# Altium schematic sheet Detektor_otwarcia.SchDoc
size A3
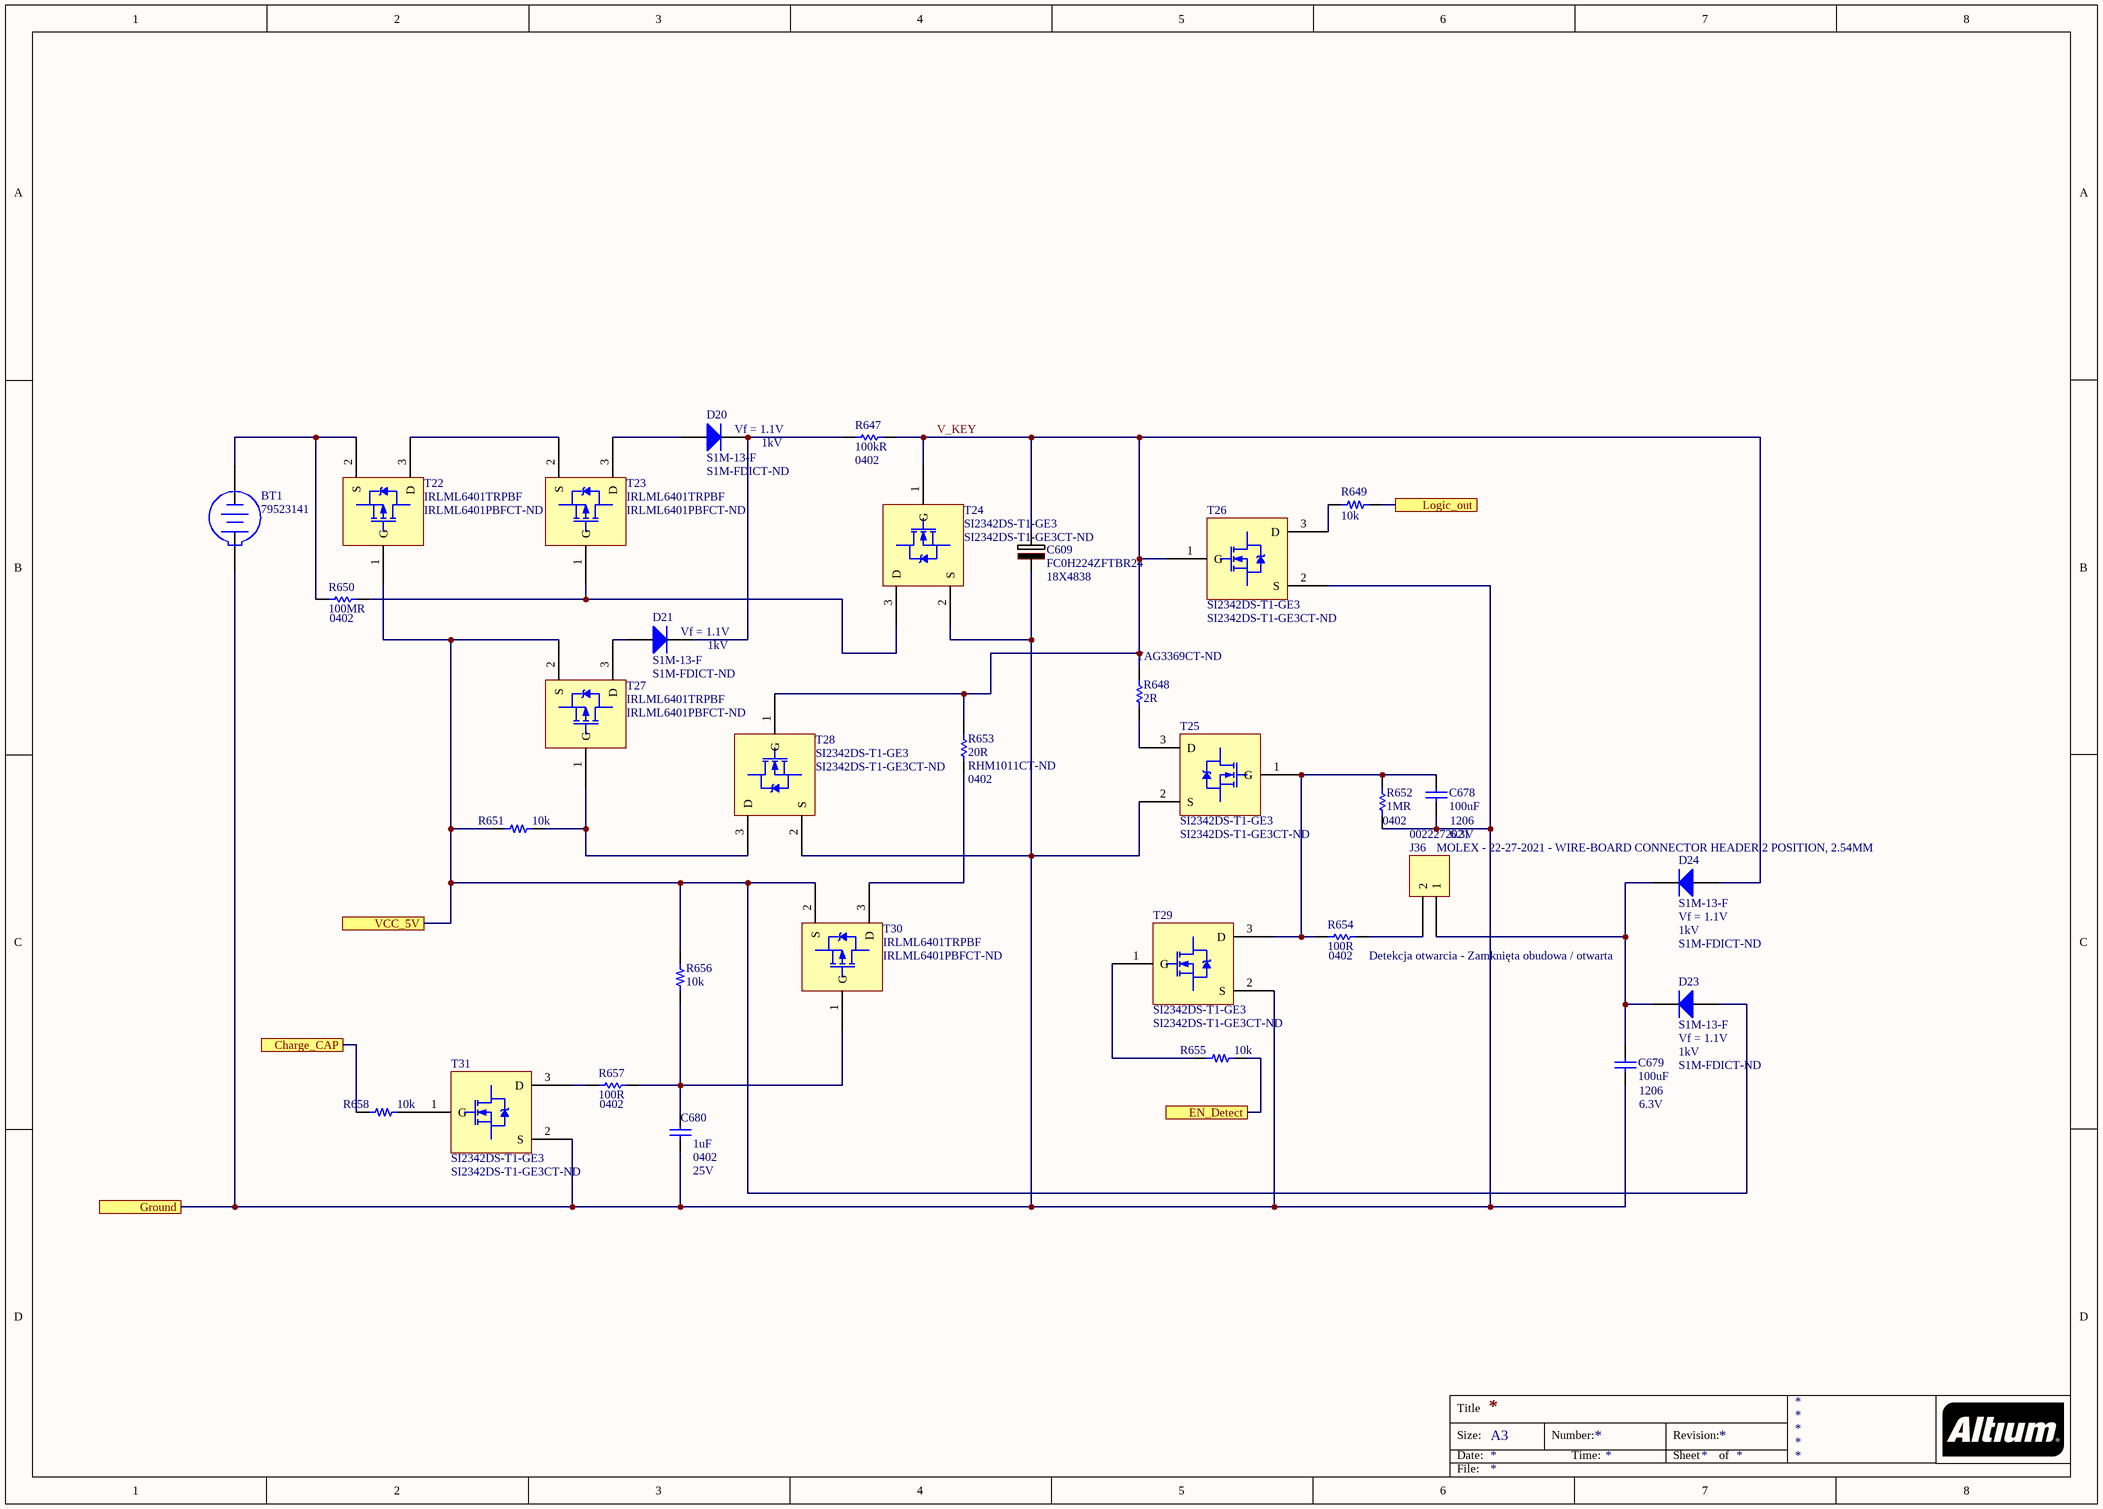
[diagram p0: Detektor_otwarcia.SchDoc]

## Parts
BT1  79523141  [79523141]
C609  FC0H224ZFTBR24  Supplier Part Number 1: 18X4838  [FC0H224ZFTBR24]
C678  100uF  Case/Package: 1206  Voltage Rating: 6.3V  [CAP 1206/3216]
C679  100uF  Case/Package: 1206  Voltage Rating: 6.3V  [CAP 1206/3216]
C680  1uF  Case/Package: 0402  Voltage Rating: 25V  [CAP 0402/1005 KK]
D20  S1M-13-F  Forward Voltage: Vf = 1.1V  Reverse Voltage (DC): 1kV  Supplier Part Number 1: S1M-FDICT-ND  [S1M-13-F]
D21  S1M-13-F  Forward Voltage: Vf = 1.1V  Reverse Voltage (DC): 1kV  Supplier Part Number 1: S1M-FDICT-ND  [S1M-13-F]
D23  S1M-13-F  Forward Voltage: Vf = 1.1V  Reverse Voltage (DC): 1kV  Supplier Part Number 1: S1M-FDICT-ND  [S1M-13-F]
D24  S1M-13-F  Forward Voltage: Vf = 1.1V  Reverse Voltage (DC): 1kV  Supplier Part Number 1: S1M-FDICT-ND  [S1M-13-F]
J36  MOLEX - 22-27-2021 - WIRE-BOARD CONNECTOR HEADER 2 POSITION, 2.54MM  Supplier Part Number 1: 0022272021  [MOLEX KK 0022272021]
R647  100kR  Case/Package: 0402  [RES 0402/1005 RF KK]
R648  2R  Supplier Part Number 1: YAG3369CT-ND  [RES 0402/1005 RF KK]
R649  10k  [RES 0402/1005 RF KK]
R650  100MR  Case/Package: 0402  [RES 0402/1005 RF KK]
R651  10k  [RES 0402/1005 RF KK]
R652  1MR  Case/Package: 0402  [RES 0402/1005 RF KK]
R653  20R  Supplier Part Number 1: RHM1011CT-ND  Case/Package: 0402  [RES 0402/1005 RF KK]
R654  100R  Case/Package: 0402  [RES 0402/1005 RF KK]
R655  10k  [RES 0402/1005 RF KK]
R656  10k  [RES 0402/1005 RF KK]
R657  100R  Case/Package: 0402  [RES 0402/1005 RF KK]
R658  10k  [RES 0402/1005 RF KK]
T22  IRLML6401TRPBF  Supplier Part Number 1: IRLML6401PBFCT-ND  [IRLML6401PbF]
T23  IRLML6401TRPBF  Supplier Part Number 1: IRLML6401PBFCT-ND  [IRLML6401PbF]
T24  SI2342DS-T1-GE3  Supplier Part Number 1: SI2342DS-T1-GE3CT-ND  [SI2342DS-T1-GE3]
T25  SI2342DS-T1-GE3  Supplier Part Number 1: SI2342DS-T1-GE3CT-ND  [SI2342DS-T1-GE3]
T26  SI2342DS-T1-GE3  Supplier Part Number 1: SI2342DS-T1-GE3CT-ND  [SI2342DS-T1-GE3]
T27  IRLML6401TRPBF  Supplier Part Number 1: IRLML6401PBFCT-ND  [IRLML6401PbF]
T28  SI2342DS-T1-GE3  Supplier Part Number 1: SI2342DS-T1-GE3CT-ND  [SI2342DS-T1-GE3]
T29  SI2342DS-T1-GE3  Supplier Part Number 1: SI2342DS-T1-GE3CT-ND  [SI2342DS-T1-GE3]
T30  IRLML6401TRPBF  Supplier Part Number 1: IRLML6401PBFCT-ND  [IRLML6401PbF]
T31  SI2342DS-T1-GE3  Supplier Part Number 1: SI2342DS-T1-GE3CT-ND  [SI2342DS-T1-GE3]

## Ports
Charge_CAP, EN_Detect, Ground, Logic_out, VCC_5V

## Nets
Charge_CAP: R658.2 ; port Charge_CAP
EN_Detect: R655.1 ; port EN_Detect
Ground: BT1.1(+) C609.1(-) C678.1 C679.1 C680.2 R652.1 T24.2(S) T25.2(S) T26.2(S) T28.2(S) T29.2(S) T31.2(S) ; port Ground
Logic_out: R649.1 ; port Logic_out
V_KEY: C609.2(+) D24.2(A) R647.1 R648.1 R653.1 T24.1(G) T26.1(G) T28.1(G)
VCC_5V: D23.2(A) R651.2 R656.1 T22.1(G) T27.2(S) T30.2(S) ; port VCC_5V
NetBT1_2: BT1.2(-) R650.1 T22.2(S)
NetC678_2: C678.2 R652.2 R654.1 T25.1(G) T29.3(D)
NetC679_2: C679.2 D23.1(K) D24.1(K) J36.1
NetC680_1: C680.1 R656.2 R657.2 T30.1(G)
NetD20_1: D20.1(K) D21.1(K) R647.2
NetD20_2: D20.2(A) T23.3(D)
NetD21_2: D21.2(A) T27.3(D)
NetJ36_2: J36.2 R654.2
NetR648_2: R648.2 T25.3(D)
NetR649_2: R649.2 T26.3(D)
NetR650_2: R650.2 T23.1(G) T24.3(D)
NetR651_1: R651.1 T27.1(G) T28.3(D)
NetR653_2: R653.2 T30.3(D)
NetR655_2: R655.2 T29.1(G)
NetR657_1: R657.1 T31.3(D)
NetR658_1: R658.1 T31.1(G)
NetT22_3: T22.3(D) T23.2(S)

## Notes on the sheet
- (near R654) Detekcja otwarcia - Zamknięta obudowa / otwarta
- Title
- Size:
- Date:
- A3
- Number:
- Time:
- Revision:
- Sheet
- of
- File:

## Library data of the parts
BT1 = 79523141: WA-BCMC Battery Holder, SMT, Battery Type 2016/2020/2025/2032; ComponentLink1Description: Manufacturer; ComponentLink1URL: http://www.we-online.de; ComponentLink2Description: Datasheet; ComponentLink2URL: https://katalog.we-online.com/em/datasheet/79523141.pdf; Published Date: September 2019; Mounting Technology: SMT; Packaging: Tape and Reel; Battery Type: 2016/2020/2025/2032; Publisher: Wurth Elektronik; Part Number: 79523141
C609 = FC0H224ZFTBR24: Supercapacitors / Ultracapacitors 0.22F 5.5volts SMD Super Capacitor; Manufacturer: KEMET; Capacitance: 220mF; Tolerance: 80%; Voltage Rating: 5.5V; ESR (Equivalent Series Resistance): 25R; Leakage Current: 330uA; Supplier 1: Newark; Manufacturer Part Number: FC0H224ZFTBR24; RoHS: Yes; Category: Capacitors; Mount: Surface Mount; Case/Package: Radial; Min Operating Temperature: -25°C; Max Operating Temperature: 70°C; Package Quantity: 500; Packaging: Tape and Reel; Voltage Rating (DC): 5.5V; Termination: SMD/SMT; Voltage: 5.5V; Diameter: 10.5mm; Length: 10.8mm; Height: 8.5mm; Width: 10.8mm; Height - Seated (Max): 0.335inch; Lead Pitch: 5mm; Depth: 8.5mm; Radiation Hardening: No; REACH SVHC: No SVHC; ComponentLink1URL: https://datasheet.ciiva.com/29533/docfinderpartnumber-fc0h224zftbr24-29533957.pdf?src-supplier=Digi-Key; ComponentLink1Description: https://datasheet.ciiva.com/29533/docfinderpartnumber-fc0h224zftbr24-29533957.pdf?src-supplier=Digi-Key; ComponentLink2URL: https://datasheet.ciiva.com/46644/70368307-46644566.pdf?src-supplier=Allied+Electronics; ComponentLink2Description: https://datasheet.ciiva.com/46644/70368307-46644566.pdf?src-supplier=Allied+Electronics; ComponentLink3URL: https://datasheet.ciiva.com/28448/1754672-28448906.pdf?src-supplier=Element14; ComponentLink3Description: https://datasheet.ciiva.com/28448/1754672-28448906.pdf?src-supplier=Element14; ComponentLink4URL: https://datasheet.ciiva.com/29984/kem-s6011-fc-29984986.pdf?src-supplier=Avnet; ComponentLink4Description: https://datasheet.ciiva.com/29984/kem-s6011-fc-29984986.pdf?src-supplier=Avnet
C678 C679 = Capacitor: Cap Ceramic 100uF 6.3V X6T 20% Pad SMD 1206 105C T/R; Manufacturer: Murata; Manufacturer Part Number: GRM31CD80J107ME39L; Dissipation Factor: 0.1%; Supplier 1: Digi-Key; Supplier Part Number 1: 490-10525-1-ND; RoHS: Yes; Category: Ceramic Capacitors; Stock 1: 262558; Pricing 1: 1=0,76000, 10=0,56100, 100=0,38470, 500=0,30454, 1000=0,25645 (USD); Mount: Surface Mount; Weight: 0.001411oz; Case Code (Metric): 3216; Case Code (Imperial): 1206; Material: Ceramic; Dielectric Material: Ceramic; Min Operating Temperature: -55°C; Max Operating Temperature: 105°C; Capacitance: 100uF; Tolerance: 20%; Dielectric: X6T; Packaging: Tape and Reel; Voltage: 6.3V; Termination: SMD/SMT; Voltage Rating (DC): 6.3V; Package Quantity: 2000; Length: 3.2mm; Height: 1.6mm; Width: 1.6mm; Thickness: 0.071inch; Depth: 1.6mm; Radiation Hardening: No; REACH SVHC: No SVHC; Lead Free: Lead Free; ComponentLink1URL: https://datasheet.ciiva.com/7719/608985-7719130.pdf?src-supplier=Element14; ComponentLink1Description: https://datasheet.ciiva.com/7719/608985-7719130.pdf?src-supplier=Element14
C680 = Capacitor: MURATA - GRT155R61E105KE01D - SMD Multilayer Ceramic Capacitor, 1 µF, 25 V, 0402 [1005 Metric], ± 10%, X5R, GRT Series - SMD Multilayer Ceramic Capacitor, 1 µF, 25 V, 0402 [1005 Metric], ± 10%, X5R, GRT Series; Supplier 1: Digi-Key; Supplier Part Number 1: 490-12263-1-ND; Manufacturer: Murata; Manufacturer Part Number: GRT155R61E105KE01D; RoHS: Yes; Category: Ceramic Capacitors; Stock 1: 341453; Pricing 1: 1=0,18000, 10=0,12300, 100=0,06210, 500=0,04248, 1000=0,03758, 2500=0,03594, 5000=0,03268 (USD); Mount: Surface Mount; Case Code (Metric): 1005; Case Code (Imperial): 0402; Min Operating Temperature: -55°C; Max Operating Temperature: 85°C; Packaging: Tape and Reel; Capacitance: 1uF; Tolerance: 10%; Dielectric: X5R; Voltage Rating (DC): 25V; Length: 0.039inch; Width: 0.02inch; Thickness: 0.022inch; Ratings: AEC-Q200; ComponentLink1URL: http://www.farnell.com/datasheets/2165918.pdf?src-supplier=Farnell; ComponentLink1Description: http://www.farnell.com/datasheets/2165918.pdf?src-supplier=Farnell; ComponentLink2URL: http://search.murata.co.jp/Ceramy/image/img/A01X/G101/ENG/GRT155R61E105KE01-01.pdf?src-supplier=Digi-Key; ComponentLink2Description: http://search.murata.co.jp/Ceramy/image/img/A01X/G101/ENG/GRT155R61E105KE01-01.pdf?src-supplier=Digi-Key; ComponentLink3URL: http://www.farnell.com/datasheets/2165918.pdf?src-supplier=Element14; ComponentLink3Description: http://www.farnell.com/datasheets/2165918.pdf?src-supplier=Element14
D20 D21 D23 D24 = S1M-13-F: DIODE GEN PURP 1KV 1A SMA; Manufacturer: Diodes; Recovery Time: 1.8us; Peak Reverse Current: 5uA; Reverse Recovery Time: 3us; Peak Non-Repetitive Surge Current: 30A; Polarity: Standard; Capacitance: 10pF; Supplier 1: Digi-Key; Manufacturer Part Number: S1M-13-F; RoHS: Yes; Category: Rectifier Diodes; Stock 1: 1021310; Pricing 1: 1=0,25000, 10=0,20100, 25=0,16840, 100=0,08240, 250=0,08104, 500=0,06870, 1000=0,04774, 2500=0,04437 (USD); Case/Package: SMA; Number of Pins: 2; Weight: 0.002258oz; Min Operating Temperature: -65°C; Max Operating Temperature: 150°C; Package Quantity: 5000; Forward Current: 1A; Packaging: Tape and Reel; Average Rectified Current: 1A; Max Repetitive Reverse Voltage (Vrrm): 1kV; Max Forward Surge Current (Ifsm): 30A; Voltage Rating (DC): 1kV; Current Rating: 1A; Output Current: 1A; Max Reverse Voltage (DC): 1kV; Termination: SMD/SMT; Length: 4.6mm; Height: 2.1mm; Width: 2.92mm; Radiation Hardening: No; REACH SVHC: No SVHC; Lead Free: Lead Free; ComponentLink1URL: https://datasheet.ciiva.com/34302/1541642-34302418.pdf?src-supplier=Jameco; ComponentLink1Description: https://datasheet.ciiva.com/34302/1541642-34302418.pdf?src-supplier=Jameco; ComponentLink2URL: https://datasheet.ciiva.com/22695/1911706-22695834.pdf?src-supplier=Element14; ComponentLink2Description: https://datasheet.ciiva.com/22695/1911706-22695834.pdf?src-supplier=Element14
J36 = 2 Pin: Number of Contacts: 2; Gender: Male; Contact Resistance: 20mR; Current Rating: 4A; Voltage Rating (DC): 250V; Insulation Resistance: 50GR; Approvals: UL,CSA; Supplier 1: Avnet; Manufacturer: Molex; Manufacturer Part Number: 22-27-2021; RoHS: Yes; Category: Headers and Wire Housings; Stock 1: 3474; Pricing 1: 1=0,12370, 10=0,11289, 30=0,10755, 50=0,10087, 100=0,09486 (USD); Mount: Through Hole; Contact Plating: Tin,Copper; Contact Material: Brass,Tin; Housing Color: Natural; Color: White; Housing Material: Nylon; Material: Nylon; Min Operating Temperature: 0°C; Max Operating Temperature: 75°C; Termination: Solder; Number of Rows: 1; Orientation: Straight; Number of Positions: 2; Packaging: Bulk; Package Quantity: 24000; Contact Gender: Male; Number of Circuits: 2; Working Voltage: 250V; Voltage Rating (AC): 250V; Voltage Rating: 250V; Max Current Rating: 4A; Length: 10.16mm; Height: 11.7mm; Pitch: 2.54mm; Depth: 5.8mm; Lead Pitch: 2.54mm; Radiation Hardening: No; Lead Free: Lead Free; Flammability Rating: UL94 V-0; REACH SVHC: Unknown; ComponentLink1URL: https://datasheet.ciiva.com/9468/0022272021-pcb-headers-9468403.pdf?src-supplier=Avnet; ComponentLink1Description: https://datasheet.ciiva.com/9468/0022272021-pcb-headers-9468403.pdf?src-supplier=Avnet; ComponentLink2URL: https://datasheet.ciiva.com/30177/113940022272021-pcb-headers-30177601.pdf?src-supplier=Onlinecomponents.com; ComponentLink2Description: https://datasheet.ciiva.com/30177/113940022272021-pcb-headers-30177601.pdf?src-supplier=Onlinecomponents.com; ComponentLink3URL: https://datasheet.ciiva.com/15217/getdatasheetpartid-163454-15217683.pdf?src-supplier=Verical; ComponentLink3Description: https://datasheet.ciiva.com/15217/getdatasheetpartid-163454-15217683.pdf?src-supplier=Verical; ComponentLink4URL: https://datasheet.ciiva.com/5154/0022272021-pcb-headers-227458-5154933.pdf?src-supplier=Mouser; ComponentLink4Description: https://datasheet.ciiva.com/5154/0022272021-pcb-headers-227458-5154933.pdf?src-supplier=Mouser; ComponentLink5URL: https://datasheet.ciiva.com/11746/0900766b804624e4-11746551.pdf?src-supplier=RSComponents; ComponentLink5Description: https://datasheet.ciiva.com/11746/0900766b804624e4-11746551.pdf?src-supplier=RSComponents; ComponentLink6URL: https://datasheet.ciiva.com/19462/879254-19462349.pdf?src-supplier=Jameco; ComponentLink6Description: https://datasheet.ciiva.com/19462/879254-19462349.pdf?src-supplier=Jameco; ComponentLink7URL: https://datasheet.ciiva.com/25908/0022272021-pcb-headers-25908245.pdf?src-supplier=Avnet+Europe; ComponentLink7Description: https://datasheet.ciiva.com/25908/0022272021-pcb-headers-25908245.pdf?src-supplier=Avnet+Europe; ComponentLink8URL: https://datasheet.ciiva.com/20207/22-0838e-20207111.pdf?src-supplier=Rapid+Electronics; ComponentLink8Description: https://datasheet.ciiva.com/20207/22-0838e-20207111.pdf?src-supplier=Rapid+Electronics
R647 = Resistor: Manufacturer 1: Panasonic; Manufacturer Part Number 1: ERA-2AED104X; Tolerance: 0.5%; Power Rating: 63mW; Voltage Rating: 25V; Temperature Coefficient: 25ppm/°C; Supplier 1: Digi-Key; Supplier Part Number 1: P100KDECT-ND; Stock 1: 54338; Pricing 1: 1=0.22000, 10=0.18800, 100=0.07350, 1000=0.03077, 2500=0.02820, 5000=0.02564 (USD); RoHS: Yes; Mount: Surface Mount; Case Code (Imperial): 0402; Case Code (Metric): 1005; Contact Plating: Tin; Min Operating Temperature: -55°C; Max Operating Temperature: 155°C; Resistance: 100kR; Packaging: Tape and Reel; Package Quantity: 10000; Composition: Metal Film,Thin Film; Number of Terminations: 2; Military Standard: Not; Termination: SMD/SMT; Max Power Dissipation: 63mW; Voltage Rating (DC): 25V; Length: 1mm; Height: 0.016inch; Width: 0.5mm; Depth: 0.5mm; Radiation Hardening: No; REACH SVHC: No SVHC; Lead Free: Lead Free; ComponentLink1URL: https://datasheet.ciiva.com/24028/aoa0000ce26-197354-24028150.pdf?src-supplier=Mouser; ComponentLink1Description: https://datasheet.ciiva.com/24028/aoa0000ce26-197354-24028150.pdf?src-supplier=Mouser; ComponentLink2URL: https://datasheet.ciiva.com/43470/1776116-43470438.pdf?src-supplier=Farnell; ComponentLink2Description: https://datasheet.ciiva.com/43470/1776116-43470438.pdf?src-supplier=Farnell; ComponentLink3URL: https://datasheet.ciiva.com/7830/1776116-7830920.pdf?src-supplier=Element14; ComponentLink3Description: https://datasheet.ciiva.com/7830/1776116-7830920.pdf?src-supplier=Element14; ComponentLink4URL: https://datasheet.ciiva.com/46378/1776116-46378234.pdf?src-supplier=Element14; ComponentLink4Description: https://datasheet.ciiva.com/46378/1776116-46378234.pdf?src-supplier=Element14; ComponentLink5URL: https://datasheet.ciiva.com/16780/70068849-16780139.pdf?src-supplier=Allied+Electronics; ComponentLink5Description: https://datasheet.ciiva.com/16780/70068849-16780139.pdf?src-supplier=Allied+Electronics; ComponentLink6URL: https://datasheet.ciiva.com/9117/aoa0000ce26-9117229.pdf?src-supplier=Avnet; ComponentLink6Description: https://datasheet.ciiva.com/9117/aoa0000ce26-9117229.pdf?src-supplier=Avnet; ComponentLink7URL: https://datasheet.ciiva.com/16511/aoa0000ce26-16511566.pdf?src-supplier=Avnet+Asia; ComponentLink7Description: https://datasheet.ciiva.com/16511/aoa0000ce26-16511566.pdf?src-supplier=Avnet+Asia; ComponentLink8URL: https://datasheet.ciiva.com/30225/54aoa0000ce26-30225311.pdf?src-supplier=Onlinecomponents.com; ComponentLink8Description: https://datasheet.ciiva.com/30225/54aoa0000ce26-30225311.pdf?src-supplier=Onlinecomponents.com
R648 = Resistor: Manufacturer 1: Yageo; Manufacturer Part Number 1: RC0402FR-072RL; Power Rating: 63mW; Tolerance: 1%; Voltage Rating: 50V; Temperature Coefficient: 200ppm/°C; Supplier 1: Digi-Key; Stock 1: 417064; Pricing 1: 1=0,10000, 10=0,02400, 100=0,00970, 1000=0,00435, 2500=0,00377, 5000=0,00312 (USD); RoHS: Yes; Case/Package: 0402; Case Code (Imperial): 0402; Case Code (Metric): 1005; Contact Plating: Tin,Matte; Min Operating Temperature: -55°C; Max Operating Temperature: 155°C; Resistance: 2R; Packaging: Tape and Reel; Composition: Thick Film; Termination: SMD/SMT; Number of Terminations: 2; Military Standard: Not; Max Power Dissipation: 63mW; Voltage Rating (DC): 50V; Features: Moisture Resistant; Length: 1mm; Height: 0.016inch; Width: 0.02inch; Depth: 0.5mm; REACH SVHC: Unknown; Lead Free: Lead Free; ComponentLink1URL: https://datasheet.ciiva.com/11808/0900766b80c66297-11808785.pdf?src-supplier=RSComponents; ComponentLink1Description: https://datasheet.ciiva.com/11808/0900766b80c66297-11808785.pdf?src-supplier=RSComponents; ComponentLink2URL: https://datasheet.ciiva.com/16868/pyu-rc0402-51-rohs-l-6-16868438.pdf?src-supplier=Avnet+Europe; ComponentLink2Description: https://datasheet.ciiva.com/16868/pyu-rc0402-51-rohs-l-6-16868438.pdf?src-supplier=Avnet+Europe; ComponentLink3URL: https://datasheet.ciiva.com/5596/pyu-rc0402-51-rohs-l-6-r-5596055.pdf?src-supplier=Mouser; ComponentLink3Description: https://datasheet.ciiva.com/5596/pyu-rc0402-51-rohs-l-6-r-5596055.pdf?src-supplier=Mouser; ComponentLink4URL: https://datasheet.ciiva.com/28415/pyu-rc0402-51-rohs-l-6-28415608.pdf?src-supplier=Avnet+Europe; ComponentLink4Description: https://datasheet.ciiva.com/28415/pyu-rc0402-51-rohs-l-6-28415608.pdf?src-supplier=Avnet+Europe; ComponentLink5URL: https://datasheet.ciiva.com/8894/pyu-rc0402-51-rohs-l-6-8894730.pdf?src-supplier=Avnet; ComponentLink5Description: https://datasheet.ciiva.com/8894/pyu-rc0402-51-rohs-l-6-8894730.pdf?src-supplier=Avnet; ComponentLink6URL: https://datasheet.ciiva.com/7849/1018594-7849950.pdf?src-supplier=Element14; ComponentLink6Description: https://datasheet.ciiva.com/7849/1018594-7849950.pdf?src-supplier=Element14; ComponentLink7URL: https://datasheet.ciiva.com/7849/1018594-7849951.pdf?src-supplier=Element14; ComponentLink7Description: https://datasheet.ciiva.com/7849/1018594-7849951.pdf?src-supplier=Element14
R649 R651 R655 R656 R658 = Resistor: SMT Resistor; Value: 10k; Part Number: *; Supplier 1: Digi-Key; Supplier Part Number 1: RR05P10.0KDCT-ND
R650 = Resistor: RES SMD 100M OHM 5% 1/16W 0402; Manufacturer: Stackpole Electronics; Manufacturer Part Number: HMC0402JT100M; Max Power Dissipation: 63mW; Temperature Coefficient: 400ppm/°C; Supplier 1: Digi-Key; Supplier Part Number 1: HMC0402JT100MCT-ND; RoHS: Yes; Category: Chip SMD Resistors; Stock 1: 245588; Pricing 1: 1=0,38000, 10=0,31800, 100=0,12420, 1000=0,05198, 2500=0,04764, 5000=0,04331 (USD); Mount: Surface Mount; Case Code (Metric): 1005; Case Code (Imperial): 0402; Min Operating Temperature: -55°C; Max Operating Temperature: 125°C; Resistance: 100MR; Tolerance: 5%; Packaging: Tape and Reel; Composition: Thick Film; Number of Terminations: 2; Military Standard: Not; Length: 0.039inch; Height: 0.016inch; Width: 0.02inch; Depth: 0.5mm; Lead Free: Lead Free; ComponentLink1URL: http://components.arrow.com/part/dataview/58476149S797766N1174?src-supplier=Arrow; ComponentLink1Description: http://components.arrow.com/part/dataview/58476149S797766N1174?src-supplier=Arrow; ComponentLink2URL: http://www.seielect.com/Catalog/SEI-HMC.pdf?src-supplier=Digi-Key; ComponentLink2Description: http://www.seielect.com/Catalog/SEI-HMC.pdf?src-supplier=Digi-Key; ComponentLink3URL: https://www.seielect.com/Catalog/SEI-HMC.pdf?src-supplier=Digi-Key; ComponentLink3Description: https://www.seielect.com/Catalog/SEI-HMC.pdf?src-supplier=Digi-Key
R652 = Resistor: RES SMD 1M OHM 1% 1/16W 0402; Manufacturer: Yageo; Manufacturer Part Number: RC0402FR-071ML; Power Rating: 63mW; Voltage Rating: 50V; Temperature Coefficient: 100ppm/°C; Supplier 1: Digi-Key; Supplier Part Number 1: 311-1.00MLRDKR-ND; RoHS: Yes; Category: Chip SMD Resistors; Stock 1: 10014745; Pricing 1: 1=0,10000, 10=0,01600, 100=0,00640, 1000=0,00289, 2500=0,00251, 5000=0,00207 (USD); Case Code (Imperial): 0402; Case Code (Metric): 1005; Min Operating Temperature: -55°C; Max Operating Temperature: 155°C; Packaging: Tape and Reel; Resistance: 1MR; Tolerance: 1%; Termination: SMD/SMT; Composition: Thick Film; Military Standard: Not; Length: 1mm; Height: 0.32mm; Depth: 0.5mm; REACH SVHC: Unknown; Lead Free: Lead Free; ComponentLink1URL: https://datasheet.ciiva.com/11808/0900766b80c66297-11808125.pdf?src-supplier=RSComponents; ComponentLink1Description: https://datasheet.ciiva.com/11808/0900766b80c66297-11808125.pdf?src-supplier=RSComponents; ComponentLink2URL: https://datasheet.ciiva.com/7849/1018594-7849883.pdf?src-supplier=Element14; ComponentLink2Description: https://datasheet.ciiva.com/7849/1018594-7849883.pdf?src-supplier=Element14; ComponentLink3URL: https://datasheet.ciiva.com/46394/1018594-46394951.pdf?src-supplier=Element14; ComponentLink3Description: https://datasheet.ciiva.com/46394/1018594-46394951.pdf?src-supplier=Element14; ComponentLink4URL: https://datasheet.ciiva.com/16741/pyu-rc0402-51-rohs-l-6-r-16741081.pdf?src-supplier=Future+Electronics; ComponentLink4Description: https://datasheet.ciiva.com/16741/pyu-rc0402-51-rohs-l-6-r-16741081.pdf?src-supplier=Future+Electronics; ComponentLink5URL: https://datasheet.ciiva.com/7849/1018594-7849882.pdf?src-supplier=Element14; ComponentLink5Description: https://datasheet.ciiva.com/7849/1018594-7849882.pdf?src-supplier=Element14
R653 = Resistor: RES SMD 20 OHM 5% 1/5W 0402; Manufacturer: Rohm; Manufacturer Part Number: ESR01MZPJ200; Max Power Dissipation: 200mW; Temperature Coefficient: 200ppm/°C; Supplier 1: Digi-Key; RoHS: Yes; Category: Chip SMD Resistors; Stock 1: 152113; Pricing 1: 1=0,23000, 10=0,19400, 100=0,07570, 1000=0,03168, 2500=0,02904, 5000=0,02640 (USD); Case Code (Metric): 1005; Case Code (Imperial): 0402; Min Operating Temperature: -55°C; Max Operating Temperature: 155°C; Package Quantity: 1; Packaging: Cut Tape; Resistance: 20R; Tolerance: 5%; Composition: Thick Film; Number of Terminations: 2; Features: Automotive AEC-Q200; Length: 0.039inch; Height: 0.016inch; Width: 0.02inch; ComponentLink1URL: https://datasheet.ciiva.com/14928/esr-14928838.pdf?src-supplier=Digi-Key; ComponentLink1Description: https://datasheet.ciiva.com/14928/esr-14928838.pdf?src-supplier=Digi-Key
R654 R657 = Resistor: RES SMD 100 OHM 1% 1/16W 0402; Manufacturer: Yageo; Manufacturer Part Number: RC0402FR-07100RL; Power Rating: 62.5mW; Voltage Rating: 50V; Temperature Coefficient: 100ppm/°C; Supplier 1: Digi-Key; Supplier Part Number 1: 311-100LRDKR-ND; RoHS: Yes; Category: Chip SMD Resistors; Stock 1: 42078262; Pricing 1: 1=0,10000, 10=0,01600, 100=0,00640, 1000=0,00289, 2500=0,00251, 5000=0,00207 (USD); Number of Pins: 2; Case Code (Imperial): 0402; Case Code (Metric): 1005; Min Operating Temperature: -55°C; Max Operating Temperature: 155°C; Tolerance: 1%; Resistance: 100R; Packaging: Tape and Reel; Termination: SMD/SMT; Composition: Thick Film; Military Standard: Not; Voltage Rating (DC): 50V; Length: 1mm; Height: 0.32mm; Depth: 0.5mm; Width: 0.5mm; REACH SVHC: No SVHC; Lead Free: Lead Free; ComponentLink1URL: https://datasheet.ciiva.com/7849/1784430-7849810.pdf?src-supplier=Element14; ComponentLink1Description: https://datasheet.ciiva.com/7849/1784430-7849810.pdf?src-supplier=Element14; ComponentLink2URL: https://datasheet.ciiva.com/11808/0900766b80c66297-11808765.pdf?src-supplier=RSComponents; ComponentLink2Description: https://datasheet.ciiva.com/11808/0900766b80c66297-11808765.pdf?src-supplier=RSComponents; ComponentLink3URL: https://datasheet.ciiva.com/12667/pyu-rc0402-51-rohs-l-6-r-12667957.pdf?src-supplier=Mouser; ComponentLink3Description: https://datasheet.ciiva.com/12667/pyu-rc0402-51-rohs-l-6-r-12667957.pdf?src-supplier=Mouser; ComponentLink4URL: https://datasheet.ciiva.com/16740/pyu-rc0402-51-rohs-l-6-r-16740566.pdf?src-supplier=Future+Electronics; ComponentLink4Description: https://datasheet.ciiva.com/16740/pyu-rc0402-51-rohs-l-6-r-16740566.pdf?src-supplier=Future+Electronics; ComponentLink5URL: https://datasheet.ciiva.com/15189/getdatasheetpartid-329466-15189335.pdf?src-supplier=Verical; ComponentLink5Description: https://datasheet.ciiva.com/15189/getdatasheetpartid-329466-15189335.pdf?src-supplier=Verical; ComponentLink6URL: https://datasheet.ciiva.com/28367/1018594-28367226.pdf?src-supplier=Element14; ComponentLink6Description: https://datasheet.ciiva.com/28367/1018594-28367226.pdf?src-supplier=Element14; ComponentLink7URL: https://datasheet.ciiva.com/22747/1018594-22747511.pdf?src-supplier=Element14; ComponentLink7Description: https://datasheet.ciiva.com/22747/1018594-22747511.pdf?src-supplier=Element14
T22 T23 T27 T30 = IRLML6401TRPBF: MOSFET MOSFT P-Ch -4.3A 50mOhm 10nC Log Lvl; Manufacturer: International Rectifier; Nominal Vgs: -550mV; Rds On Max: 50mR; Input Capacitance: 830pF; Rise Time: 32ns; Max Power Dissipation: 1.3W; Number of Elements: 1; Dual Supply Voltage: -12V; Drain to Source Voltage (Vdss): 12V; Continuous Drain Current (ID): 4.3A; Gate to Source Voltage (Vgs): 8V; Turn-On Delay Time: 11ns; Turn-Off Delay Time: 250ns; Fall Time: 210ns; Element Configuration: Single; Supplier 1: Digi-Key; Manufacturer Part Number: IRLML6401TRPBF; RoHS: Yes; Category: MOSFETs; Stock 1: 90278; Pricing 1: 1=0,37000, 10=0,30300, 25=0,27680, 100=0,17380, 250=0,17188, 500=0,16096, 1000=0,10945 (USD); Mount: Surface Mount; Case/Package: SOT-23; Number of Pins: 3; Min Operating Temperature: -55°C; Max Operating Temperature: 150°C; Packaging: Tape and Reel; Package Quantity: 1; Drain to Source Resistance: 50mR; Power Dissipation: 1.3W; Threshold Voltage: -550mV; Termination: SMD/SMT; Drain to Source Breakdown Voltage: -12V; Voltage Rating (DC): -12V; Current Rating: -4.3A; On-State Resistance: 50mR; Length: 3.04mm; Height: 1.02mm; Width: 1.4mm; Radiation Hardening: No; REACH SVHC: No SVHC; Lead Free: Lead Free; ComponentLink1URL: https://datasheet.ciiva.com/6131/irlml6401-6131072.pdf?src-supplier=Farnell; ComponentLink1Description: https://datasheet.ciiva.com/6131/irlml6401-6131072.pdf?src-supplier=Farnell; ComponentLink2URL: https://datasheet.ciiva.com/6383/irlml6401pbf-6383328.pdf?src-supplier=Digi-Key; ComponentLink2Description: https://datasheet.ciiva.com/6383/irlml6401pbf-6383328.pdf?src-supplier=Digi-Key; ComponentLink3URL: https://datasheet.ciiva.com/34302/1563711-34302499.pdf?src-supplier=Jameco; ComponentLink3Description: https://datasheet.ciiva.com/34302/1563711-34302499.pdf?src-supplier=Jameco; ComponentLink4URL: https://datasheet.ciiva.com/6383/irlml6401pbf-6383326.pdf?src-supplier=Digi-Key; ComponentLink4Description: https://datasheet.ciiva.com/6383/irlml6401pbf-6383326.pdf?src-supplier=Digi-Key
T24-T26 T28 T29 T31 = SI2342DS-T1-GE3: Trans MOSFET N-CH 8V 6A 3-Pin SOT-23 T/R; Manufacturer: Vishay; Rds On Max: 17mR; Input Capacitance: 1.07nF; Rise Time: 14ns; Max Power Dissipation: 2.5W; Number of Elements: 1; Power Dissipation: 1.3W; Turn-On Delay Time: 6ns; Turn-Off Delay Time: 65ns; Fall Time: 25ns; Threshold Voltage: 800mV; Gate to Source Voltage (Vgs): 5V; Supplier 1: Digi-Key; Manufacturer Part Number: SI2342DS-T1-GE3; RoHS: Yes; Category: MOSFETs; Stock 1: 25972; Pricing 1: 1=0,50000, 10=0,42500, 25=0,39640, 100=0,29460, 250=0,27984, 500=0,23000, 1000=0,18695 (USD); Mount: Surface Mount; Case/Package: SOT-23; Number of Pins: 3; Contact Plating: Tin,Matte; Min Operating Temperature: -55°C; Max Operating Temperature: 150°C; Packaging: Tape and Reel; Package Quantity: 3000; Drain to Source Voltage (Vdss): 8V; Continuous Drain Current (ID): 6A; Radiation Hardening: No; REACH SVHC: No SVHC; Lead Free: Lead Free; ComponentLink1URL: https://datasheet.ciiva.com/14905/si2342ds-14905257.pdf?src-supplier=Arrow; ComponentLink1Description: https://datasheet.ciiva.com/14905/si2342ds-14905257.pdf?src-supplier=Arrow; ComponentLink2URL: https://datasheet.ciiva.com/29746/si2342ds-29746581.pdf?src-supplier=Digi-Key; ComponentLink2Description: https://datasheet.ciiva.com/29746/si2342ds-29746581.pdf?src-supplier=Digi-Key; ComponentLink3URL: https://datasheet.ciiva.com/30021/si2342ds-30021814.pdf?src-supplier=Avnet; ComponentLink3Description: https://datasheet.ciiva.com/30021/si2342ds-30021814.pdf?src-supplier=Avnet